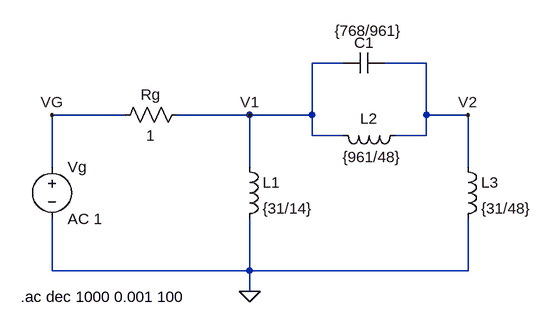
[diagram p0: schematic punto1_circuito_completo.asc]
punto1_circuito_completo.asc, the LTspice schematic file:
Version 4
SHEET 1 1660 1040
WIRE 480 -16 432 -16
WIRE 608 -16 544 -16
WIRE 144 64 32 64
WIRE 336 64 224 64
WIRE 432 64 432 -16
WIRE 432 64 336 64
WIRE 608 64 608 -16
WIRE 672 64 608 64
WIRE 432 96 432 64
WIRE 480 96 432 96
WIRE 608 96 608 64
WIRE 608 96 560 96
WIRE 32 144 32 64
WIRE 336 144 336 64
WIRE 672 144 672 64
WIRE 32 304 32 224
WIRE 336 304 336 224
WIRE 336 304 32 304
WIRE 672 304 672 224
WIRE 672 304 336 304
WIRE 336 336 336 304
FLAG 336 336 0
FLAG 32 64 VG
FLAG 336 64 V1
FLAG 672 64 V2
SYMBOL voltage 32 128 R0
SYMATTR InstName Vg
SYMATTR Value AC 1
SYMBOL res 240 48 R90
WINDOW 0 0 56 VBottom 2
WINDOW 3 32 56 VTop 2
SYMATTR InstName Rg
SYMATTR Value 1
SYMBOL ind 320 128 R0
SYMATTR InstName L1
SYMATTR Value {31/14}
SYMATTR SpiceLine Rser=1n
SYMBOL ind 576 80 R90
WINDOW 0 5 56 VBottom 2
WINDOW 3 33 51 VTop 2
SYMATTR InstName L2
SYMATTR Value {961/48}
SYMATTR SpiceLine Rser=0
SYMBOL ind 656 128 R0
SYMATTR InstName L3
SYMATTR Value {31/48}
SYMATTR SpiceLine Rser=0
SYMBOL cap 544 -32 R90
WINDOW 0 0 32 VBottom 2
WINDOW 3 -49 25 VTop 2
SYMATTR InstName C1
SYMATTR Value {768/961}
TEXT -16 344 Left 2 !.ac dec 1000 0.001 100

The netlist it stands for:
* punto1_circuito_completo.asc
Vg VG 0 AC 1
Rg V1 VG 1
L1 V1 0 {31/14} Rser=1n
L2 V2 V1 {961/48} Rser=0
L3 V2 0 {31/48} Rser=0
C1 V2 V1 {768/961}
.ac dec 1000 0.001 100
.backanno
.end